# Altium project adau1979-fpga.PrjPcb (part 3 of 6)
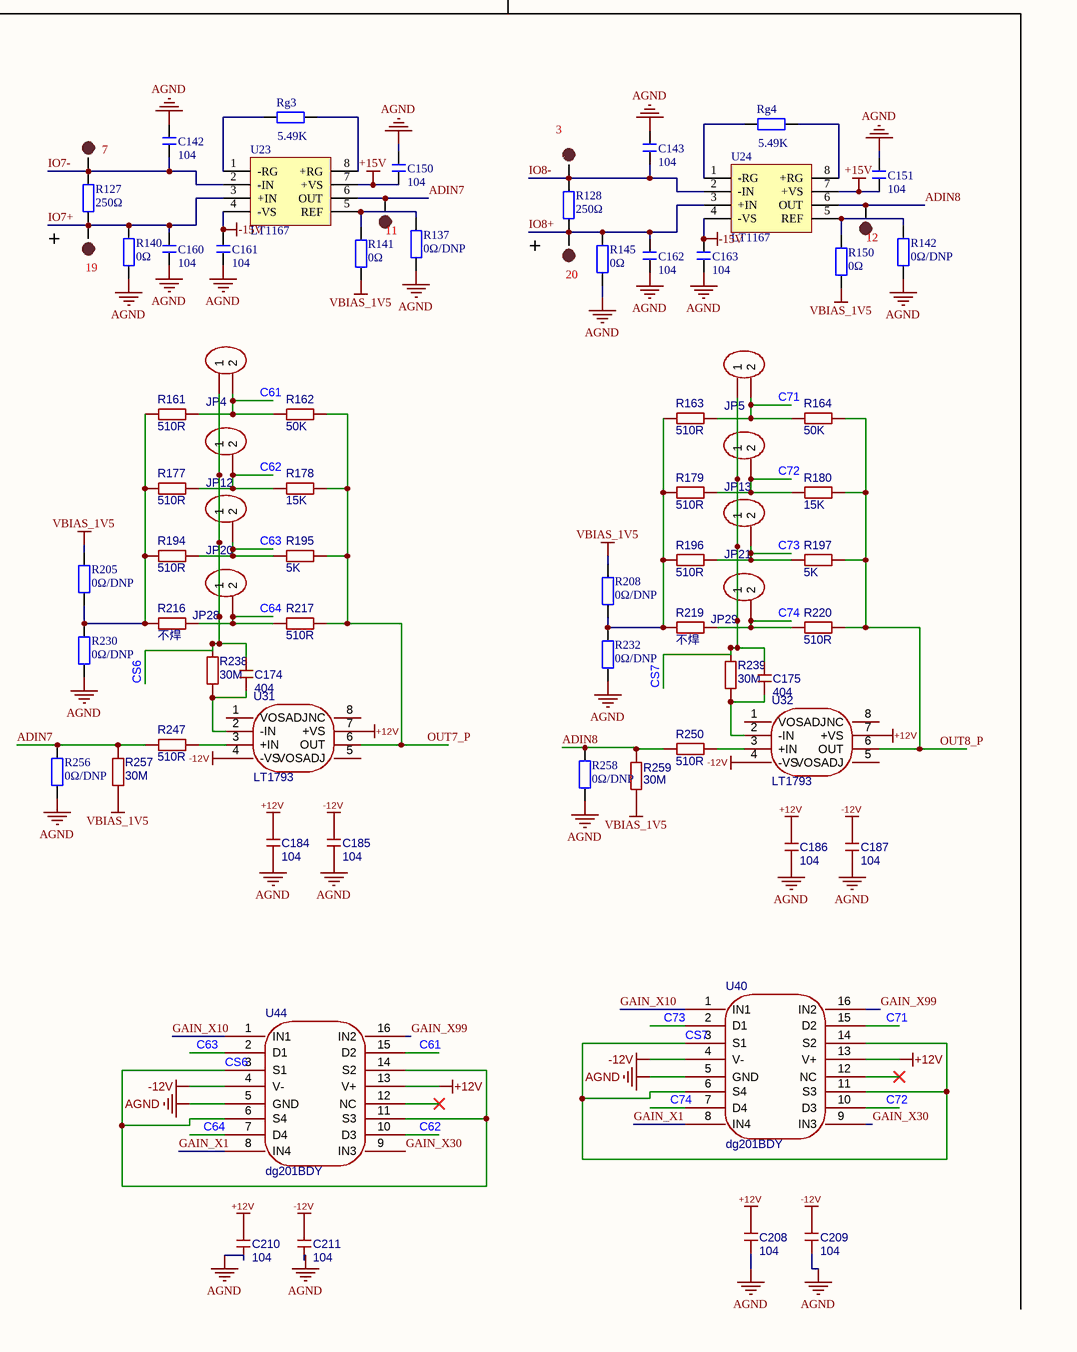
[diagram p108: adau1979_fpga.SchDoc, bottom right]

## Sheet adau1979_fpga.SchDoc (continued)
JP12 = Header 2: 2P接插件; 版权归属: 封装库来自淘宝 ID：黄晶宝石; Origin Footprint: XH2.54-WI-2P; OriginFootprint 2: XH2.54-LI-2P; OriginFootprint 3: HDR2.54-M-LI-2P; OriginFootprint 4: HDR2.54-WI-2P; OriginFootprint 5: HDR2.54-WS-2P; OriginFootprint 7: HDR2.54-M-WS-2P; OriginFootprint 8: KF2510-LI-2P; OriginFootprint 9: XH2.54-WS-2P; OriginFootprint 10: XH2.54-LS-2P; OriginFootprint 11: KF2EDGK-2.54-LI-2P; OriginFootprint 12: KF2EDGK-2.54-WI-2P; UniqueId: 6d8656e8ed237838; AddInBom: yes; OriginModelName: HDR2.54-1P; Device: Header 2; BOM名称: 2P接插件; 联系售后: https://shop463601444.taobao.com; OriginFootprint 6: HDR2.54-Y-LI-2P; DesignItemID: Header 2; LibraryName: 5.4 - 接插件-脚距2.54 (100mil); SymbolName: Header 2; FootprintName: HDR2.54-LI-2P
JP13 = Header 2: 2P接插件; 版权归属: 封装库来自淘宝 ID：黄晶宝石; Origin Footprint: XH2.54-WI-2P; OriginFootprint 2: XH2.54-LI-2P; OriginFootprint 3: HDR2.54-M-LI-2P; OriginFootprint 4: HDR2.54-WI-2P; OriginFootprint 5: HDR2.54-WS-2P; OriginFootprint 7: HDR2.54-M-WS-2P; OriginFootprint 8: KF2510-LI-2P; OriginFootprint 9: XH2.54-WS-2P; OriginFootprint 10: XH2.54-LS-2P; OriginFootprint 11: KF2EDGK-2.54-LI-2P; OriginFootprint 12: KF2EDGK-2.54-WI-2P; UniqueId: fcba59359dd8e679; AddInBom: yes; OriginModelName: HDR2.54-1P; Device: Header 2; BOM名称: 2P接插件; 联系售后: https://shop463601444.taobao.com; OriginFootprint 6: HDR2.54-Y-LI-2P; DesignItemID: Header 2; LibraryName: 5.4 - 接插件-脚距2.54 (100mil); SymbolName: Header 2; FootprintName: HDR2.54-LI-2P
JP14 = Header 2: 2P接插件; 版权归属: 封装库来自淘宝 ID：黄晶宝石; Origin Footprint: XH2.54-WI-2P; OriginFootprint 2: XH2.54-LI-2P; OriginFootprint 3: HDR2.54-M-LI-2P; OriginFootprint 4: HDR2.54-WI-2P; OriginFootprint 5: HDR2.54-WS-2P; OriginFootprint 7: HDR2.54-M-WS-2P; OriginFootprint 8: KF2510-LI-2P; OriginFootprint 9: XH2.54-WS-2P; OriginFootprint 10: XH2.54-LS-2P; OriginFootprint 11: KF2EDGK-2.54-LI-2P; OriginFootprint 12: KF2EDGK-2.54-WI-2P; UniqueId: 2c2198ed19c983b6; AddInBom: yes; OriginModelName: HDR2.54-1P; Device: Header 2; BOM名称: 2P接插件; 联系售后: https://shop463601444.taobao.com; OriginFootprint 6: HDR2.54-Y-LI-2P; DesignItemID: Header 2; LibraryName: 5.4 - 接插件-脚距2.54 (100mil); SymbolName: Header 2; FootprintName: HDR2.54-LI-2P
JP15 = Header 2: 2P接插件; 版权归属: 封装库来自淘宝 ID：黄晶宝石; Origin Footprint: XH2.54-WI-2P; OriginFootprint 2: XH2.54-LI-2P; OriginFootprint 3: HDR2.54-M-LI-2P; OriginFootprint 4: HDR2.54-WI-2P; OriginFootprint 5: HDR2.54-WS-2P; OriginFootprint 7: HDR2.54-M-WS-2P; OriginFootprint 8: KF2510-LI-2P; OriginFootprint 9: XH2.54-WS-2P; OriginFootprint 10: XH2.54-LS-2P; OriginFootprint 11: KF2EDGK-2.54-LI-2P; OriginFootprint 12: KF2EDGK-2.54-WI-2P; UniqueId: 2a3f0cfc6900396e; AddInBom: yes; OriginModelName: HDR2.54-1P; Device: Header 2; BOM名称: 2P接插件; 联系售后: https://shop463601444.taobao.com; OriginFootprint 6: HDR2.54-Y-LI-2P; DesignItemID: Header 2; LibraryName: 5.4 - 接插件-脚距2.54 (100mil); SymbolName: Header 2; FootprintName: HDR2.54-LI-2P
JP16 = Header 2: 2P接插件; 版权归属: 封装库来自淘宝 ID：黄晶宝石; Origin Footprint: XH2.54-WI-2P; OriginFootprint 2: XH2.54-LI-2P; OriginFootprint 3: HDR2.54-M-LI-2P; OriginFootprint 4: HDR2.54-WI-2P; OriginFootprint 5: HDR2.54-WS-2P; OriginFootprint 7: HDR2.54-M-WS-2P; OriginFootprint 8: KF2510-LI-2P; OriginFootprint 9: XH2.54-WS-2P; OriginFootprint 10: XH2.54-LS-2P; OriginFootprint 11: KF2EDGK-2.54-LI-2P; OriginFootprint 12: KF2EDGK-2.54-WI-2P; UniqueId: 57b57ccbe062354d; AddInBom: yes; OriginModelName: HDR2.54-1P; Device: Header 2; BOM名称: 2P接插件; 联系售后: https://shop463601444.taobao.com; OriginFootprint 6: HDR2.54-Y-LI-2P; DesignItemID: Header 2; LibraryName: 5.4 - 接插件-脚距2.54 (100mil); SymbolName: Header 2; FootprintName: HDR2.54-LI-2P
JP17 = Header 2: 2P接插件; 版权归属: 封装库来自淘宝 ID：黄晶宝石; Origin Footprint: XH2.54-WI-2P; OriginFootprint 2: XH2.54-LI-2P; OriginFootprint 3: HDR2.54-M-LI-2P; OriginFootprint 4: HDR2.54-WI-2P; OriginFootprint 5: HDR2.54-WS-2P; OriginFootprint 7: HDR2.54-M-WS-2P; OriginFootprint 8: KF2510-LI-2P; OriginFootprint 9: XH2.54-WS-2P; OriginFootprint 10: XH2.54-LS-2P; OriginFootprint 11: KF2EDGK-2.54-LI-2P; OriginFootprint 12: KF2EDGK-2.54-WI-2P; UniqueId: c40e93d5b111b9de; AddInBom: yes; OriginModelName: HDR2.54-1P; Device: Header 2; BOM名称: 2P接插件; 联系售后: https://shop463601444.taobao.com; OriginFootprint 6: HDR2.54-Y-LI-2P; DesignItemID: Header 2; LibraryName: 5.4 - 接插件-脚距2.54 (100mil); SymbolName: Header 2; FootprintName: HDR2.54-LI-2P
JP18 = Header 2: 2P接插件; 版权归属: 封装库来自淘宝 ID：黄晶宝石; Origin Footprint: XH2.54-WI-2P; OriginFootprint 2: XH2.54-LI-2P; OriginFootprint 3: HDR2.54-M-LI-2P; OriginFootprint 4: HDR2.54-WI-2P; OriginFootprint 5: HDR2.54-WS-2P; OriginFootprint 7: HDR2.54-M-WS-2P; OriginFootprint 8: KF2510-LI-2P; OriginFootprint 9: XH2.54-WS-2P; OriginFootprint 10: XH2.54-LS-2P; OriginFootprint 11: KF2EDGK-2.54-LI-2P; OriginFootprint 12: KF2EDGK-2.54-WI-2P; UniqueId: d84cd54a2cd93ea0; AddInBom: yes; OriginModelName: HDR2.54-1P; Device: Header 2; BOM名称: 2P接插件; 联系售后: https://shop463601444.taobao.com; OriginFootprint 6: HDR2.54-Y-LI-2P; DesignItemID: Header 2; LibraryName: 5.4 - 接插件-脚距2.54 (100mil); SymbolName: Header 2; FootprintName: HDR2.54-LI-2P
JP19 = Header 2: 2P接插件; 版权归属: 封装库来自淘宝 ID：黄晶宝石; Origin Footprint: XH2.54-WI-2P; OriginFootprint 2: XH2.54-LI-2P; OriginFootprint 3: HDR2.54-M-LI-2P; OriginFootprint 4: HDR2.54-WI-2P; OriginFootprint 5: HDR2.54-WS-2P; OriginFootprint 7: HDR2.54-M-WS-2P; OriginFootprint 8: KF2510-LI-2P; OriginFootprint 9: XH2.54-WS-2P; OriginFootprint 10: XH2.54-LS-2P; OriginFootprint 11: KF2EDGK-2.54-LI-2P; OriginFootprint 12: KF2EDGK-2.54-WI-2P; UniqueId: dacbd2010d520776; AddInBom: yes; OriginModelName: HDR2.54-1P; Device: Header 2; BOM名称: 2P接插件; 联系售后: https://shop463601444.taobao.com; OriginFootprint 6: HDR2.54-Y-LI-2P; DesignItemID: Header 2; LibraryName: 5.4 - 接插件-脚距2.54 (100mil); SymbolName: Header 2; FootprintName: HDR2.54-LI-2P
JP20 = Header 2: 2P接插件; 版权归属: 封装库来自淘宝 ID：黄晶宝石; Origin Footprint: XH2.54-WI-2P; OriginFootprint 2: XH2.54-LI-2P; OriginFootprint 3: HDR2.54-M-LI-2P; OriginFootprint 4: HDR2.54-WI-2P; OriginFootprint 5: HDR2.54-WS-2P; OriginFootprint 7: HDR2.54-M-WS-2P; OriginFootprint 8: KF2510-LI-2P; OriginFootprint 9: XH2.54-WS-2P; OriginFootprint 10: XH2.54-LS-2P; OriginFootprint 11: KF2EDGK-2.54-LI-2P; OriginFootprint 12: KF2EDGK-2.54-WI-2P; UniqueId: 61cd62acef56a4b1; AddInBom: yes; OriginModelName: HDR2.54-1P; Device: Header 2; BOM名称: 2P接插件; 联系售后: https://shop463601444.taobao.com; OriginFootprint 6: HDR2.54-Y-LI-2P; DesignItemID: Header 2; LibraryName: 5.4 - 接插件-脚距2.54 (100mil); SymbolName: Header 2; FootprintName: HDR2.54-LI-2P
JP21 = Header 2: 2P接插件; 版权归属: 封装库来自淘宝 ID：黄晶宝石; Origin Footprint: XH2.54-WI-2P; OriginFootprint 2: XH2.54-LI-2P; OriginFootprint 3: HDR2.54-M-LI-2P; OriginFootprint 4: HDR2.54-WI-2P; OriginFootprint 5: HDR2.54-WS-2P; OriginFootprint 7: HDR2.54-M-WS-2P; OriginFootprint 8: KF2510-LI-2P; OriginFootprint 9: XH2.54-WS-2P; OriginFootprint 10: XH2.54-LS-2P; OriginFootprint 11: KF2EDGK-2.54-LI-2P; OriginFootprint 12: KF2EDGK-2.54-WI-2P; UniqueId: 228f0eb2e9fc8410; AddInBom: yes; OriginModelName: HDR2.54-1P; Device: Header 2; BOM名称: 2P接插件; 联系售后: https://shop463601444.taobao.com; OriginFootprint 6: HDR2.54-Y-LI-2P; DesignItemID: Header 2; LibraryName: 5.4 - 接插件-脚距2.54 (100mil); SymbolName: Header 2; FootprintName: HDR2.54-LI-2P
JP22 = Header 2: 2P接插件; 版权归属: 封装库来自淘宝 ID：黄晶宝石; Origin Footprint: XH2.54-WI-2P; OriginFootprint 2: XH2.54-LI-2P; OriginFootprint 3: HDR2.54-M-LI-2P; OriginFootprint 4: HDR2.54-WI-2P; OriginFootprint 5: HDR2.54-WS-2P; OriginFootprint 7: HDR2.54-M-WS-2P; OriginFootprint 8: KF2510-LI-2P; OriginFootprint 9: XH2.54-WS-2P; OriginFootprint 10: XH2.54-LS-2P; OriginFootprint 11: KF2EDGK-2.54-LI-2P; OriginFootprint 12: KF2EDGK-2.54-WI-2P; UniqueId: 8401f236ce86758e; AddInBom: yes; OriginModelName: HDR2.54-1P; Device: Header 2; BOM名称: 2P接插件; 联系售后: https://shop463601444.taobao.com; OriginFootprint 6: HDR2.54-Y-LI-2P; DesignItemID: Header 2; LibraryName: 5.4 - 接插件-脚距2.54 (100mil); SymbolName: Header 2; FootprintName: HDR2.54-LI-2P
JP23 = Header 2: 2P接插件; 版权归属: 封装库来自淘宝 ID：黄晶宝石; Origin Footprint: XH2.54-WI-2P; OriginFootprint 2: XH2.54-LI-2P; OriginFootprint 3: HDR2.54-M-LI-2P; OriginFootprint 4: HDR2.54-WI-2P; OriginFootprint 5: HDR2.54-WS-2P; OriginFootprint 7: HDR2.54-M-WS-2P; OriginFootprint 8: KF2510-LI-2P; OriginFootprint 9: XH2.54-WS-2P; OriginFootprint 10: XH2.54-LS-2P; OriginFootprint 11: KF2EDGK-2.54-LI-2P; OriginFootprint 12: KF2EDGK-2.54-WI-2P; UniqueId: 81515d3ba89c45d7; AddInBom: yes; OriginModelName: HDR2.54-1P; Device: Header 2; BOM名称: 2P接插件; 联系售后: https://shop463601444.taobao.com; OriginFootprint 6: HDR2.54-Y-LI-2P; DesignItemID: Header 2; LibraryName: 5.4 - 接插件-脚距2.54 (100mil); SymbolName: Header 2; FootprintName: HDR2.54-LI-2P
JP24 = Header 2: 2P接插件; 版权归属: 封装库来自淘宝 ID：黄晶宝石; Origin Footprint: XH2.54-WI-2P; OriginFootprint 2: XH2.54-LI-2P; OriginFootprint 3: HDR2.54-M-LI-2P; OriginFootprint 4: HDR2.54-WI-2P; OriginFootprint 5: HDR2.54-WS-2P; OriginFootprint 7: HDR2.54-M-WS-2P; OriginFootprint 8: KF2510-LI-2P; OriginFootprint 9: XH2.54-WS-2P; OriginFootprint 10: XH2.54-LS-2P; OriginFootprint 11: KF2EDGK-2.54-LI-2P; OriginFootprint 12: KF2EDGK-2.54-WI-2P; UniqueId: 0a06460673946c5c; AddInBom: yes; OriginModelName: HDR2.54-1P; Device: Header 2; BOM名称: 2P接插件; 联系售后: https://shop463601444.taobao.com; OriginFootprint 6: HDR2.54-Y-LI-2P; DesignItemID: Header 2; LibraryName: 5.4 - 接插件-脚距2.54 (100mil); SymbolName: Header 2; FootprintName: HDR2.54-LI-2P
JP25 = Header 2: 2P接插件; 版权归属: 封装库来自淘宝 ID：黄晶宝石; Origin Footprint: XH2.54-WI-2P; OriginFootprint 2: XH2.54-LI-2P; OriginFootprint 3: HDR2.54-M-LI-2P; OriginFootprint 4: HDR2.54-WI-2P; OriginFootprint 5: HDR2.54-WS-2P; OriginFootprint 7: HDR2.54-M-WS-2P; OriginFootprint 8: KF2510-LI-2P; OriginFootprint 9: XH2.54-WS-2P; OriginFootprint 10: XH2.54-LS-2P; OriginFootprint 11: KF2EDGK-2.54-LI-2P; OriginFootprint 12: KF2EDGK-2.54-WI-2P; UniqueId: ac1a4a7fdd8dee85; AddInBom: yes; OriginModelName: HDR2.54-1P; Device: Header 2; BOM名称: 2P接插件; 联系售后: https://shop463601444.taobao.com; OriginFootprint 6: HDR2.54-Y-LI-2P; DesignItemID: Header 2; LibraryName: 5.4 - 接插件-脚距2.54 (100mil); SymbolName: Header 2; FootprintName: HDR2.54-LI-2P
JP26 = Header 2: 2P接插件; 版权归属: 封装库来自淘宝 ID：黄晶宝石; Origin Footprint: XH2.54-WI-2P; OriginFootprint 2: XH2.54-LI-2P; OriginFootprint 3: HDR2.54-M-LI-2P; OriginFootprint 4: HDR2.54-WI-2P; OriginFootprint 5: HDR2.54-WS-2P; OriginFootprint 7: HDR2.54-M-WS-2P; OriginFootprint 8: KF2510-LI-2P; OriginFootprint 9: XH2.54-WS-2P; OriginFootprint 10: XH2.54-LS-2P; OriginFootprint 11: KF2EDGK-2.54-LI-2P; OriginFootprint 12: KF2EDGK-2.54-WI-2P; UniqueId: 7ff5f6d6ea161ff3; AddInBom: yes; OriginModelName: HDR2.54-1P; Device: Header 2; BOM名称: 2P接插件; 联系售后: https://shop463601444.taobao.com; OriginFootprint 6: HDR2.54-Y-LI-2P; DesignItemID: Header 2; LibraryName: 5.4 - 接插件-脚距2.54 (100mil); SymbolName: Header 2; FootprintName: HDR2.54-LI-2P
JP27 = Header 2: 2P接插件; 版权归属: 封装库来自淘宝 ID：黄晶宝石; Origin Footprint: XH2.54-WI-2P; OriginFootprint 2: XH2.54-LI-2P; OriginFootprint 3: HDR2.54-M-LI-2P; OriginFootprint 4: HDR2.54-WI-2P; OriginFootprint 5: HDR2.54-WS-2P; OriginFootprint 7: HDR2.54-M-WS-2P; OriginFootprint 8: KF2510-LI-2P; OriginFootprint 9: XH2.54-WS-2P; OriginFootprint 10: XH2.54-LS-2P; OriginFootprint 11: KF2EDGK-2.54-LI-2P; OriginFootprint 12: KF2EDGK-2.54-WI-2P; UniqueId: 02277a1cd8d596a2; AddInBom: yes; OriginModelName: HDR2.54-1P; Device: Header 2; BOM名称: 2P接插件; 联系售后: https://shop463601444.taobao.com; OriginFootprint 6: HDR2.54-Y-LI-2P; DesignItemID: Header 2; LibraryName: 5.4 - 接插件-脚距2.54 (100mil); SymbolName: Header 2; FootprintName: HDR2.54-LI-2P
JP28 = Header 2: 2P接插件; 版权归属: 封装库来自淘宝 ID：黄晶宝石; Origin Footprint: XH2.54-WI-2P; OriginFootprint 2: XH2.54-LI-2P; OriginFootprint 3: HDR2.54-M-LI-2P; OriginFootprint 4: HDR2.54-WI-2P; OriginFootprint 5: HDR2.54-WS-2P; OriginFootprint 7: HDR2.54-M-WS-2P; OriginFootprint 8: KF2510-LI-2P; OriginFootprint 9: XH2.54-WS-2P; OriginFootprint 10: XH2.54-LS-2P; OriginFootprint 11: KF2EDGK-2.54-LI-2P; OriginFootprint 12: KF2EDGK-2.54-WI-2P; UniqueId: 0f3af21d7fc89682; AddInBom: yes; OriginModelName: HDR2.54-1P; Device: Header 2; BOM名称: 2P接插件; 联系售后: https://shop463601444.taobao.com; OriginFootprint 6: HDR2.54-Y-LI-2P; DesignItemID: Header 2; LibraryName: 5.4 - 接插件-脚距2.54 (100mil); SymbolName: Header 2; FootprintName: HDR2.54-LI-2P
JP29 = Header 2: 2P接插件; 版权归属: 封装库来自淘宝 ID：黄晶宝石; Origin Footprint: XH2.54-WI-2P; OriginFootprint 2: XH2.54-LI-2P; OriginFootprint 3: HDR2.54-M-LI-2P; OriginFootprint 4: HDR2.54-WI-2P; OriginFootprint 5: HDR2.54-WS-2P; OriginFootprint 7: HDR2.54-M-WS-2P; OriginFootprint 8: KF2510-LI-2P; OriginFootprint 9: XH2.54-WS-2P; OriginFootprint 10: XH2.54-LS-2P; OriginFootprint 11: KF2EDGK-2.54-LI-2P; OriginFootprint 12: KF2EDGK-2.54-WI-2P; UniqueId: 935b54861c2e40de; AddInBom: yes; OriginModelName: HDR2.54-1P; Device: Header 2; BOM名称: 2P接插件; 联系售后: https://shop463601444.taobao.com; OriginFootprint 6: HDR2.54-Y-LI-2P; DesignItemID: Header 2; LibraryName: 5.4 - 接插件-脚距2.54 (100mil); SymbolName: Header 2; FootprintName: HDR2.54-LI-2P
JP30 = Header 2: 2P接插件; 版权归属: 封装库来自淘宝 ID：黄晶宝石; Origin Footprint: XH2.54-WI-2P; OriginFootprint 2: XH2.54-LI-2P; OriginFootprint 3: HDR2.54-M-LI-2P; OriginFootprint 4: HDR2.54-WI-2P; OriginFootprint 5: HDR2.54-WS-2P; OriginFootprint 7: HDR2.54-M-WS-2P; OriginFootprint 8: KF2510-LI-2P; OriginFootprint 9: XH2.54-WS-2P; OriginFootprint 10: XH2.54-LS-2P; OriginFootprint 11: KF2EDGK-2.54-LI-2P; OriginFootprint 12: KF2EDGK-2.54-WI-2P; UniqueId: 12cb931c49908c91; AddInBom: yes; OriginModelName: HDR2.54-1P; Device: Header 2; BOM名称: 2P接插件; 联系售后: https://shop463601444.taobao.com; OriginFootprint 6: HDR2.54-Y-LI-2P; DesignItemID: Header 2; LibraryName: 5.4 - 接插件-脚距2.54 (100mil); SymbolName: Header 2; FootprintName: HDR2.54-LI-2P
JP31 = Header 2: 2P接插件; 版权归属: 封装库来自淘宝 ID：黄晶宝石; Origin Footprint: XH2.54-WI-2P; OriginFootprint 2: XH2.54-LI-2P; OriginFootprint 3: HDR2.54-M-LI-2P; OriginFootprint 4: HDR2.54-WI-2P; OriginFootprint 5: HDR2.54-WS-2P; OriginFootprint 7: HDR2.54-M-WS-2P; OriginFootprint 8: KF2510-LI-2P; OriginFootprint 9: XH2.54-WS-2P; OriginFootprint 10: XH2.54-LS-2P; OriginFootprint 11: KF2EDGK-2.54-LI-2P; OriginFootprint 12: KF2EDGK-2.54-WI-2P; UniqueId: c76a900f0ccf0344; AddInBom: yes; OriginModelName: HDR2.54-1P; Device: Header 2; BOM名称: 2P接插件; 联系售后: https://shop463601444.taobao.com; OriginFootprint 6: HDR2.54-Y-LI-2P; DesignItemID: Header 2; LibraryName: 5.4 - 接插件-脚距2.54 (100mil); SymbolName: Header 2; FootprintName: HDR2.54-LI-2P
JP32 = Header 2: 2P接插件; 版权归属: 封装库来自淘宝 ID：黄晶宝石; Origin Footprint: XH2.54-WI-2P; OriginFootprint 2: XH2.54-LI-2P; OriginFootprint 3: HDR2.54-M-LI-2P; OriginFootprint 4: HDR2.54-WI-2P; OriginFootprint 5: HDR2.54-WS-2P; OriginFootprint 7: HDR2.54-M-WS-2P; OriginFootprint 8: KF2510-LI-2P; OriginFootprint 9: XH2.54-WS-2P; OriginFootprint 10: XH2.54-LS-2P; OriginFootprint 11: KF2EDGK-2.54-LI-2P; OriginFootprint 12: KF2EDGK-2.54-WI-2P; UniqueId: 3883b53b87c5b88a; AddInBom: yes; OriginModelName: HDR2.54-1P; Device: Header 2; BOM名称: 2P接插件; 联系售后: https://shop463601444.taobao.com; OriginFootprint 6: HDR2.54-Y-LI-2P; DesignItemID: Header 2; LibraryName: 5.4 - 接插件-脚距2.54 (100mil); SymbolName: Header 2; FootprintName: HDR2.54-LI-2P
JP33 = Header 2: 2P接插件; 版权归属: 封装库来自淘宝 ID：黄晶宝石; Origin Footprint: XH2.54-WI-2P; OriginFootprint 2: XH2.54-LI-2P; OriginFootprint 3: HDR2.54-M-LI-2P; OriginFootprint 4: HDR2.54-WI-2P; OriginFootprint 5: HDR2.54-WS-2P; OriginFootprint 7: HDR2.54-M-WS-2P; OriginFootprint 8: KF2510-LI-2P; OriginFootprint 9: XH2.54-WS-2P; OriginFootprint 10: XH2.54-LS-2P; OriginFootprint 11: KF2EDGK-2.54-LI-2P; OriginFootprint 12: KF2EDGK-2.54-WI-2P; UniqueId: 4fe8deccf3ecd12b; AddInBom: yes; OriginModelName: HDR2.54-1P; Device: Header 2; BOM名称: 2P接插件; 联系售后: https://shop463601444.taobao.com; OriginFootprint 6: HDR2.54-Y-LI-2P; DesignItemID: Header 2; LibraryName: 5.4 - 接插件-脚距2.54 (100mil); SymbolName: Header 2; FootprintName: HDR2.54-LI-2P
L1-L3 L6 L10 = L: 小功率贴片电感; 淘宝ID: 封装库来自淘宝 ID：黄晶宝石; 封装库来自淘宝卖家 ID：黄晶宝石: 其他店铺购入均为盗版，不享受售后技术支持服务，请立即申请退款; BOM名称: 小功率贴片电感; 联系售后: https://shop463601444.taobao.com
L4 = Inductor: Code_IEC: 1005; Value: 15uH   0.6A; Published: 8-Jun-2000; LatestRevisionDate: 29-May-2009; LatestRevisionNote: IPC-7351 Footprint Added.; PackageReference: 0402-A; Publisher: Altium Limited; PackageDescription: Chip Inductor; Code_JEITA: 0402
L5 = mpz1608s221ata00: 标称阻抗@测试频率:220Ω@100MHz;误差:±25%;直流电阻(RDC):50mΩ;; Manufacturer: TDK; AddInBom: yes; ModelId: 2bc5ec593d464d6ba9807aec0b5673c2; ModelName: L0603_L1.6-W0.8-H0.5_BEAD; ModelTransform: 62.992,31.496,0,180,0,0,0.094,0.629,0; Tolerance: ±25%; DC Resistance: 50mΩ; Current Rating: 2.2A; Circuits: 1; Symbol: MPZ1608S221ATA00; LCSC Part Name: 单路 0603磁珠 阻抗220Ω@100MHz; SupplierPart: C76815; ManufacturerPart: MPZ1608S221ATA00; Supplier Footprint: 0603; JLCPCB Part Class: Extended Part; Datasheet: https://atta.szlcsc.com/upload/public/pdf/source/20160918/1474166931723.pdf; Supplier: LCSC; ConvertToPcb: yes; FootprintName: L0603; Impedance @ Frequency: 220Ω@100MHz
L7 L9 = blm31pg121sn1l: 阻抗@频率:120Ω@100MHz;误差:±25%;直流电阻(DCR):20mΩ;; Manufacturer: muRata(村田); AddInBom: yes; ModelId: 85bdab7b3d4c4074b81d208eb5e865b3; ModelName: L1206_L3.2-W1.6-H1.1; ModelTransform: 125.984,62.835,0,0,0,0,0,0,0; Tolerance: ±25%; DC Resistance(DCR): 20mΩ; Current Rating: 3.5A; Number of Circuits: 1; Symbol: BLM31PG121SN1L; LCSC Part Name: 单路 1206磁珠 阻抗120Ω@100MHz; SupplierPart: C85841; ManufacturerPart: BLM31PG121SN1L; Supplier Footprint: 1206; JLCPCB Part Class: Extended Part; Datasheet: https://item.szlcsc.com/datasheet/BLM31PG121SN1L/87017.html; Supplier: LCSC; ConvertToPcb: yes; FootprintName: L1206; Impedance @ Frequency: 120Ω@100MHz; Operating Temperature: -55℃~+125℃
L8 = srn6045ta-4r7m: 电感值:4.7uH;精度:±20%;额定电流:4.5A;饱和电流(Isat):6.8A;类型:-;; Manufacturer: BOURNS; AddInBom: yes; ModelId: 30081a2752cd45e4871fd4480d5f295c; ModelName: IND-SMD_L6.0-W6.0-H4.5; ModelTransform: 236.22,237.007,0,90,0,0,-0.005,0,0; Value: 4.7uH; Tolerance: ±20%; Current Rating: 4.5A; Current - Saturation(Isat): 6.8A; DC Resistance(DCR): 26mΩ; Symbol: SRN6045TA-4R7M; LCSC Part Name: 4.7uH ±20% 6.8A; SupplierPart: C2044594; ManufacturerPart: SRN6045TA-4R7M; Supplier Footprint: SMD,6x6mm; JLCPCB Part Class: Extended Part; Datasheet: https://item.szlcsc.com/datasheet/SRN6045TA-4R7M/2136160.html; Supplier: LCSC; ConvertToPcb: yes; FootprintName: IND-SMD_L6.0-W6.0; Type: -
LED1 = LED: 发光二极管; 技术支持，联系售后: https://shop463601444.taobao.com
OSC1 = ot2el4c4ji-111olp-24.576m: 频率:24.576MHz;常温频差:±10ppm;输出模式:CMOS;工作电压:1.8V~3.3V;频率稳定度:±20ppm;; Manufacturer: YXC(扬兴晶振); AddInBom: yes; ModelId: ae22b8d143894765bc8100c37cb6356f; ModelName: OSC-SMD_4P-L3.2-W2.5-H1.0; ModelTransform: 125.984,98.425,0,0,0,0,0,0,0; Normal temperature Frequency Tolerance: ±10ppm; Output Type: CMOS; Frequency Stability: ±20ppm; Symbol: OT2EL4C4JI-111OLP-24.576M; LCSC Part Name: YSO110TR 24.576MHZ 1.8V-3.3V ±10PPM -40~85℃（±20PPM) CMOS; SupplierPart: C5203547; ManufacturerPart: OT2EL4C4JI-111OLP-24.576M; Supplier Footprint: SMD3225-4P; JLCPCB Part Class: Extended Part; Datasheet: https://item.szlcsc.com/datasheet/OT2EL4C4JI-111OLP-24.576M/5892909.html; Supplier: LCSC; ConvertToPcb: yes; FootprintName: OSC-SMD_4P-L3.2-W2.5-BL; Value: 24.576MHz; Voltage - Supply: 1.8V~3.3V; Operating Temperature: -40℃~+85℃
P1 = wj500v-5.08-03p-14-00a: 结构:1x3P;间距:5.08mm;颜色:绿色;安装类型:直插;排数:1;每排PIN数:3;额定电流:18A;额定电压:250V;线规 - AWG:14~30;线规 - 平方毫米:2.5;工作温度:-40℃~+105℃;; Manufacturer: KANGNEX(康奈克斯电气); Symbol: WJ500V-5.08-3P-14-00A; AddInBom: yes; ModelId: f80d5090781743d49abcb05979f5618f; ModelTransform: 623.621,393.7,0,0,0,0,11.811,-20.315,-177.165; Number of Positions or Pins: 1x3P; Pitch: 5.08mm; Number of PINs Per Row: 3; Screw Specification: M2.5; Current Rating: 18A; Voltage Rating (Max): 250V; Wire Gauge - AWG: 14~30; Wire Gauge - mm2: 2.5; LCSC Part Name: 1x3P 5.08mm 直插 排数:1 每排P数:3; SupplierPart: C72334; ManufacturerPart: WJ500V-5.08-03P-14-00A; Supplier Footprint: 插件,P=5.08mm; JLCPCB Part Class: Extended Part; Datasheet: https://item.szlcsc.com/datasheet/WJ500V-5.08-03P-14-00A/73443.html; Supplier: LCSC; ConvertToPcb: yes; FootprintName: CONN-TH_3P-P5.00_WJ500V-5.08-3P; ModelName: CONN-TH_3P-P5.00_WJ500V-5.08-3P; Color: 绿色; Mounting Type: 直插; Number of Pins: 3P; Number of Rows: 1; Operating Temperature: -40℃~+105℃; Height Above Board: 14.07mm
P2 = Header 2: Header, 2-Pin; LatestRevisionDate: 17-Jul-2002; LatestRevisionNote: Re-released for DXP Platform.; Publisher: Altium Limited